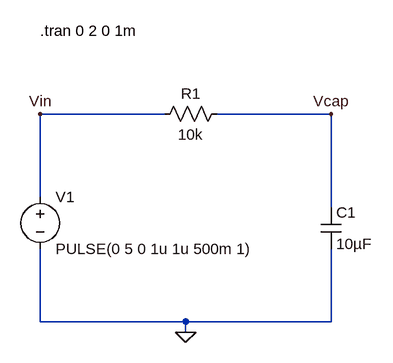
[diagram p0: schematic W01_D06_RC_Charging_Discharging.asc]
W01_D06_RC_Charging_Discharging.asc, the LTspice schematic file:
Version 4.1
SHEET 1 880 680
WIRE 256 -32 64 -32
WIRE 512 -32 336 -32
WIRE 64 96 64 -32
WIRE 512 112 512 -32
WIRE 64 288 64 176
WIRE 288 288 64 288
WIRE 512 288 512 176
WIRE 512 288 288 288
WIRE 288 304 288 288
FLAG 288 304 0
FLAG 512 -32 Vcap
FLAG 64 -32 Vin
SYMBOL voltage 64 80 R0
WINDOW 123 0 0 Left 0
WINDOW 39 0 0 Left 0
SYMATTR InstName V1
SYMATTR Value PULSE(0 5 0 1u 1u 500m 1)
SYMBOL res 352 -48 R90
WINDOW 0 0 56 VBottom 2
WINDOW 3 32 56 VTop 2
SYMATTR InstName R1
SYMATTR Value 10k
SYMBOL cap 496 112 R0
SYMATTR InstName C1
SYMATTR Value 10µF
TEXT 64 -160 Left 2 !.tran 0 2 0 1m

The netlist it stands for:
* W01_D06_RC_Charging_Discharging.asc
V1 Vin 0 PULSE(0 5 0 1u 1u 500m 1)
R1 Vcap Vin 10k
C1 Vcap 0 10µF
.tran 0 2 0 1m
.backanno
.end